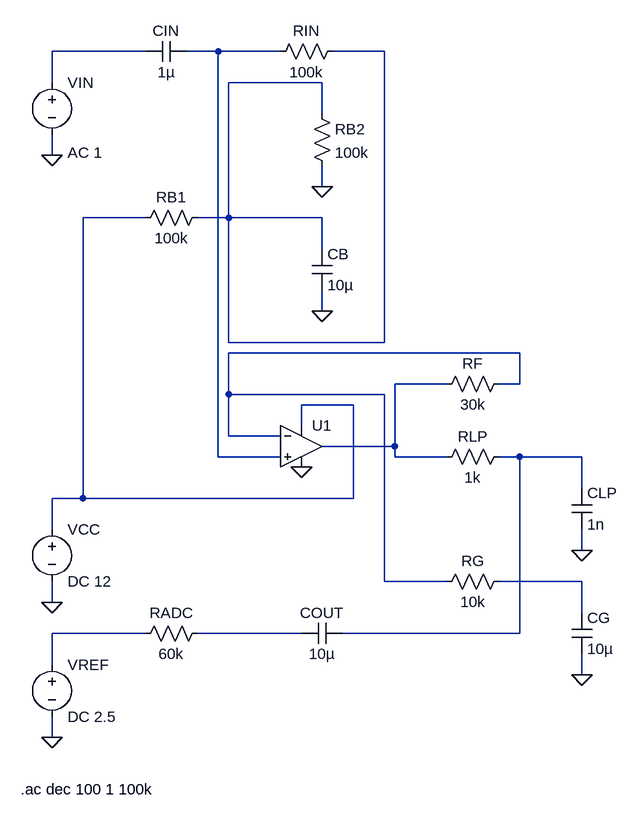
[diagram p0: schematic sample_v0.asc]
sample_v0.asc, the LTspice schematic file:
Version 4.1
SHEET 1 1200 1216
WIRE 192 32 48 32
WIRE 304 32 256 32
WIRE 400 32 304 32
WIRE 560 32 480 32
WIRE 48 80 48 32
WIRE 464 80 320 80
WIRE 464 128 464 80
WIRE 48 192 48 160
WIRE 464 240 464 208
WIRE 192 288 96 288
WIRE 320 288 320 80
WIRE 320 288 272 288
WIRE 464 288 320 288
WIRE 464 336 464 288
WIRE 464 432 464 400
WIRE 320 480 320 288
WIRE 560 480 560 32
WIRE 560 480 320 480
WIRE 768 496 320 496
WIRE 656 544 576 544
WIRE 768 544 768 496
WIRE 768 544 736 544
WIRE 320 560 320 496
WIRE 560 560 320 560
WIRE 512 576 432 576
WIRE 432 608 432 576
WIRE 320 624 320 560
WIRE 400 624 320 624
WIRE 576 640 576 544
WIRE 576 640 464 640
WIRE 304 656 304 32
WIRE 400 656 304 656
WIRE 576 656 576 640
WIRE 656 656 576 656
WIRE 768 656 736 656
WIRE 864 656 768 656
WIRE 864 704 864 656
WIRE 96 720 96 288
WIRE 96 720 48 720
WIRE 512 720 512 576
WIRE 512 720 96 720
WIRE 48 768 48 720
WIRE 864 800 864 768
WIRE 560 848 560 560
WIRE 656 848 560 848
WIRE 864 848 736 848
WIRE 48 880 48 848
WIRE 864 896 864 848
WIRE 192 928 48 928
WIRE 432 928 272 928
WIRE 768 928 768 656
WIRE 768 928 496 928
WIRE 48 976 48 928
WIRE 864 992 864 960
WIRE 48 1088 48 1056
FLAG 48 880 0
FLAG 48 1088 0
FLAG 464 240 0
FLAG 464 432 0
FLAG 48 192 0
FLAG 864 992 0
FLAG 864 800 0
FLAG 432 672 0
SYMBOL voltage 48 752 R0
SYMATTR InstName VCC
SYMATTR Value DC 12
SYMBOL voltage 48 960 R0
SYMATTR InstName VREF
SYMATTR Value DC 2.5
SYMBOL res 176 304 R270
WINDOW 0 32 56 VTop 2
WINDOW 3 0 56 VBottom 2
SYMATTR InstName RB1
SYMATTR Value 100k
SYMBOL res 448 112 R0
SYMATTR InstName RB2
SYMATTR Value 100k
SYMBOL cap 448 336 R0
SYMATTR InstName CB
SYMATTR Value 10µ
SYMBOL voltage 48 64 R0
WINDOW 3 24 152 Left 2
WINDOW 123 24 124 Left 2
WINDOW 39 0 0 Left 0
SYMATTR InstName VIN
SYMATTR Value ""
SYMATTR Value2 AC 1
SYMBOL cap 192 48 R270
WINDOW 0 32 32 VTop 2
WINDOW 3 0 32 VBottom 2
SYMATTR InstName CIN
SYMATTR Value 1µ
SYMBOL res 384 48 R270
WINDOW 0 32 56 VTop 2
WINDOW 3 0 56 VBottom 2
SYMATTR InstName RIN
SYMATTR Value 100k
SYMBOL res 640 560 R270
WINDOW 0 32 56 VTop 2
WINDOW 3 0 56 VBottom 2
SYMATTR InstName RF
SYMATTR Value 30k
SYMBOL res 640 864 R270
WINDOW 0 32 56 VTop 2
WINDOW 3 0 56 VBottom 2
SYMATTR InstName RG
SYMATTR Value 10k
SYMBOL cap 848 896 R0
SYMATTR InstName CG
SYMATTR Value 10µ
SYMBOL res 640 672 R270
WINDOW 0 32 56 VTop 2
WINDOW 3 0 56 VBottom 2
SYMATTR InstName RLP
SYMATTR Value 1k
SYMBOL cap 848 704 R0
SYMATTR InstName CLP
SYMATTR Value 1n
SYMBOL cap 432 944 R270
WINDOW 0 32 32 VTop 2
WINDOW 3 0 32 VBottom 2
SYMATTR InstName COUT
SYMATTR Value 10µ
SYMBOL res 176 944 R270
WINDOW 0 32 56 VTop 2
WINDOW 3 0 56 VBottom 2
SYMATTR InstName RADC
SYMATTR Value 60k
SYMBOL OpAmps\\UniversalOpAmp2 432 640 R0
SYMATTR InstName U1
TEXT 0 1168 Left 2 !.ac dec 100 1 100k

The netlist it stands for:
* sample_v0.asc
VCC N004 0 DC 12
VREF N009 0 DC 2.5
RB1 N004 N003 100k
RB2 N003 0 100k
CB N003 0 10µ
VIN N001 0 AC 1
CIN N001 N002 1µ
RIN N002 N003 100k
RF N006 N005 30k
RG N005 N008 10k
CG N008 0 10µ
RLP N006 N007 1k
CLP N007 0 1n
COUT N010 N007 10µ
RADC N009 N010 60k
X§U1 N002 N005 N004 0 N006 level2 Avol=1Meg GBW=10Meg Slew=10Meg Ilimit=25m Rail=0 Vos=0 En=0 Enk=0 In=0 Ink=0 Rin=500Meg  ; pins In+ In- V+ V- OUT
.ac dec 100 1 100k
.lib UniversalOpAmp2.lib
.backanno
.end